# Altium schematic sheet A313_10.SchDoc
size 513 x 386 mm
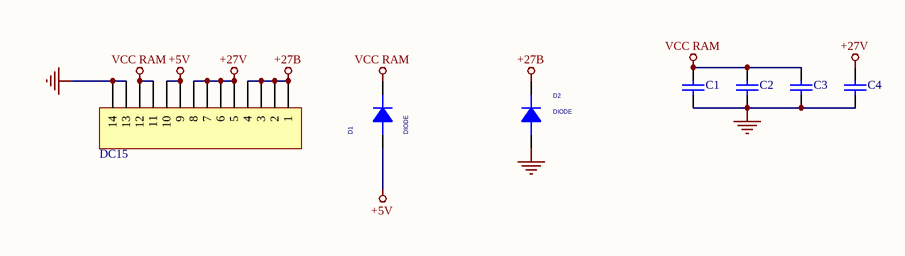
[diagram p0: A313_10.SchDoc]

## Parts
C1  (no value)
C2  (no value)
C3  (no value)
C4  (no value)
D1  DIODE  [DIOT NAN]
D2  DIODE  [DIOT NAN]
DC15  (no value)  [DC14c]

## Nets
+5V: D1.1(A) DC15.9 DC15.10
+27B: D2.2(K) DC15.1 DC15.2 DC15.3 DC15.4
+27V: C4.2 DC15.5 DC15.6 DC15.7 DC15.8
GND: C1.1 C2.1 C3.1 C4.1 D2.1(A) DC15.13 DC15.14
VCC RAM: C1.2 C2.2 C3.2 D1.2(K) DC15.11 DC15.12

## Library data of the parts
C1-C4 = Cap: Capacitor; Published: 8-Jun-2000; LatestRevisionDate: 17-Jul-2002; LatestRevisionNote: Re-released for DXP Platform.; PackageReference: RAD-0.3; Publisher: Altium Limited; PackageDescription: Radial Cap, Thru-Hole; 2 Leads; 0.3 in Pin Spacing
DC15 = Header 14: Header, 14-Pin; LatestRevisionDate: 17-Jul-2002; LatestRevisionNote: Re-released for DXP Platform.; Publisher: Altium Limited